# Altium project Carrier-Board-v1.0.PrjPcb (part 5 of 9)

## Sheet FUTURE_USE_CONNECTOR.SchDoc
size A4; SheetNumber: 10; SheetTotal: 20
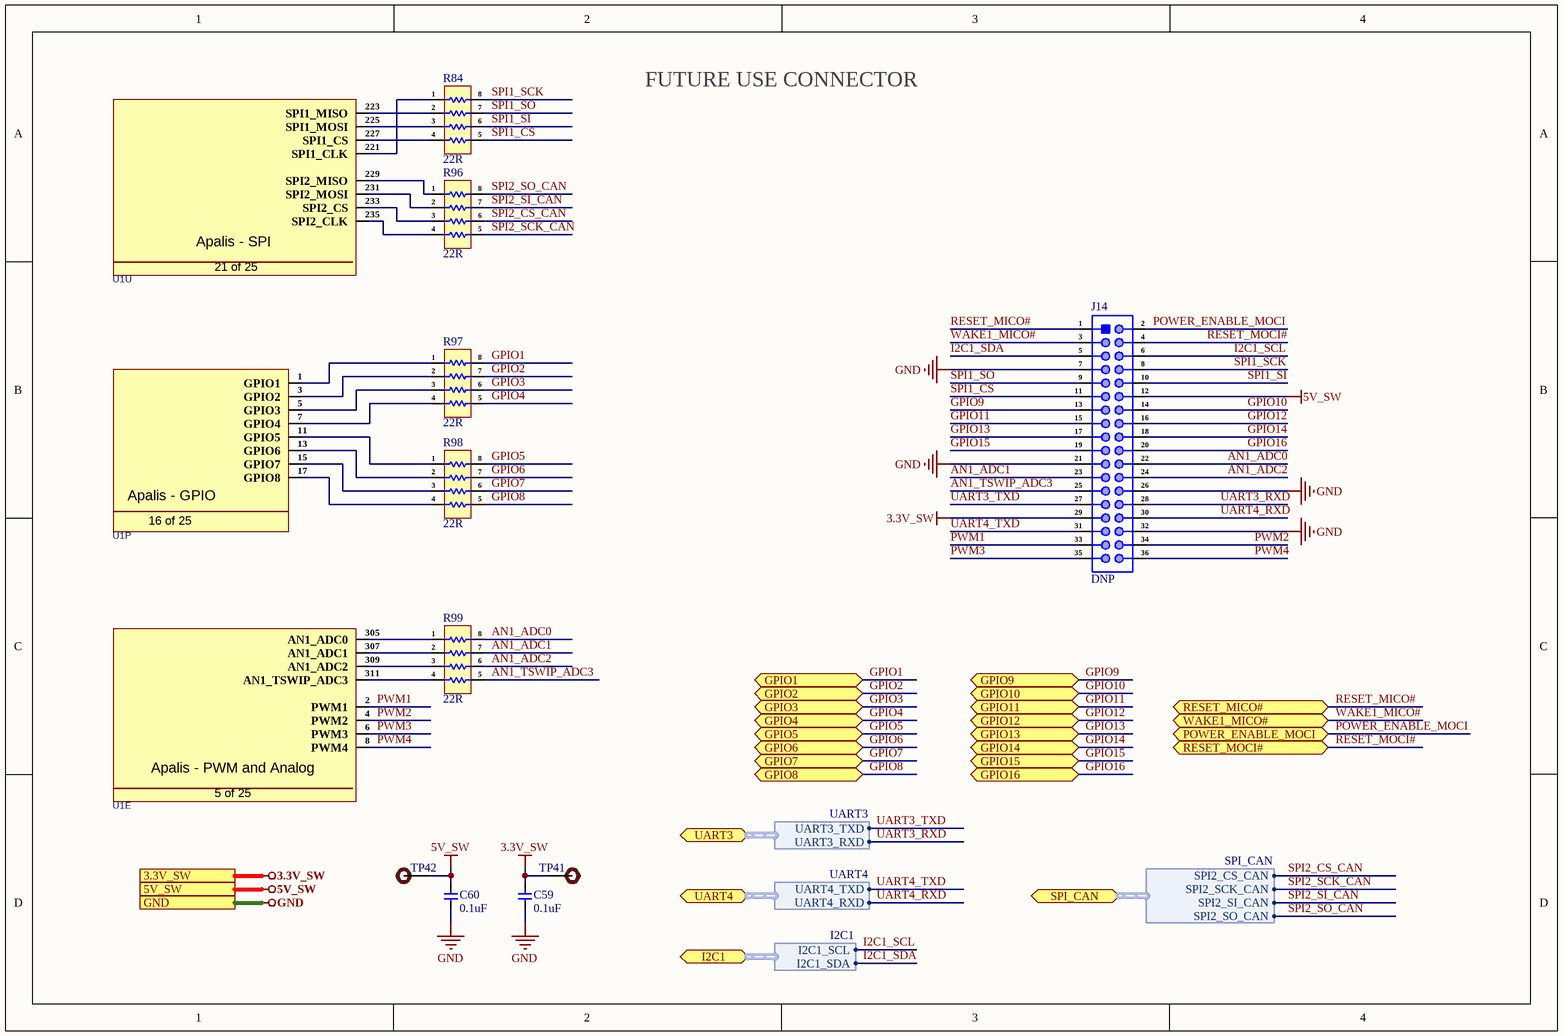
[diagram p9: FUTURE_USE_CONNECTOR.SchDoc]

### Parts
C59  0.1uF  [Cap-0402]
C60  0.1uF  [Cap-0402]
J14  DNP  [ESHF-118-01-L-D-SM-TR]
R84  22R  [YC164-JR-0722RL]
R96  22R  [YC164-JR-0722RL]
R97  22R  [YC164-JR-0722RL]
R98  22R  [YC164-JR-0722RL]
R99  22R  [YC164-JR-0722RL]
TP41  DNP  [Test-point]  (value not drawn)
TP42  DNP  [Test-point]  (value not drawn)
U1  MM70-314B1-2-R300  [MM70-314B1-2-R300]  (value not drawn)  (parts E,P,U of 25)

### Ports
3.3V_SW (see Top_Sheet[2A], DIGITAL_I-O_O-P[1D], ETHERNET_INTERFACE[1D], HDMI_INTERFACE[1D], I2C_INTERFACE[1B], MICRO_SD_CARD_INTERFACE[1D], UART_INTERFACE[1D]), 5V_SW (see Top_Sheet[2A], APALIS_POWER_SUPPLY[1D], CODEC_INTERFACE[1D], HDMI_INTERFACE[1D], LTE_MODULE[1D], USB3.0_INTERFACE[1D]), GND (see Top_Sheet[2A], 03-CAN2_SPI_CAN_CONTROLLER[1D], APALIS_POWER_SUPPLY[1D], CAN2_SPI_CAN_CONTROLLER[1D], CODEC_INTERFACE[1D], CONNECTORS[1D], DC_DC_CONVERTER[1D], DIGITAL_I-O_O-P[1D], ETHERNET_INTERFACE[1D], GPIO_NC_INTERFACE[4B], HDMI_INTERFACE[1D], I2C_INTERFACE[1B], INPUT_SUPPLY_PROTECTION[1D], LTE_MODULE[1D], MECHANICAL_FOR_PCB[1D], MICRO_SD_CARD_INTERFACE[1D], Reset_and_SDIO[1D], UART_INTERFACE[1D], USB3.0_INTERFACE[1D]), GPIO1 (bidir, see Top_Sheet[3B], DIGITAL_I-O_O-P[1C]), GPIO2 (bidir, see Top_Sheet[3B], DIGITAL_I-O_O-P[1C]), GPIO3 (bidir, see Top_Sheet[3B], DIGITAL_I-O_O-P[1C]), GPIO4 (bidir, see Top_Sheet[3B], DIGITAL_I-O_O-P[1C]), GPIO5 (bidir, see Top_Sheet[2A], CONNECTORS[2D]), GPIO6 (bidir, see Top_Sheet[2A], CONNECTORS[2D]), GPIO7 (bidir, see Top_Sheet[2A], CONNECTORS[2D]), GPIO8 (bidir, see Top_Sheet[2A], CONNECTORS[2D]), GPIO9 (bidir, see Top_Sheet[2A], CONNECTORS[2D], GPIO_NC_INTERFACE[1D]), GPIO10 (bidir, see Top_Sheet[2A], GPIO_NC_INTERFACE[1D]), GPIO11 (bidir, see Top_Sheet[2B], CONNECTORS[2D], GPIO_NC_INTERFACE[3B]), GPIO12 (bidir, see Top_Sheet[2B], CONNECTORS[2D], GPIO_NC_INTERFACE[3B]), GPIO13 (bidir, see Top_Sheet[2B], CONNECTORS[2D], GPIO_NC_INTERFACE[3B]), GPIO14 (bidir, see Top_Sheet[2B], GPIO_NC_INTERFACE[2A]), GPIO15 (bidir, see Top_Sheet[2B], GPIO_NC_INTERFACE[2A]), GPIO16 (bidir, see Top_Sheet[3B], GPIO_NC_INTERFACE[2A]), I2C1 (bidir, harness I2C1, see Top_Sheet[3A], CONNECTORS[2C], I2C_INTERFACE[4B]), POWER_ENABLE_MOCI (bidir, see Top_Sheet[3A], Reset_and_SDIO[3D]), RESET_MICO# (bidir, see Top_Sheet[3A], Reset_and_SDIO[3D]), RESET_MOCI# (bidir, see Top_Sheet[3A], Reset_and_SDIO[3D]), SPI_CAN (bidir, harness SPI_CAN, see Top_Sheet[2B], CAN2_SPI_CAN_CONTROLLER[3D]), UART3 (bidir, harness UART3, see Top_Sheet[2B], UART_INTERFACE[3D]), UART4 (bidir, harness UART4, see Top_Sheet[2B], UART_INTERFACE[3D]), WAKE1_MICO# (bidir, see Top_Sheet[3A], I2C_INTERFACE[2B], Reset_and_SDIO[3D])

### Harnesses
I2C1: I2C1_SCL, I2C1_SDA
UART3: UART3_TXD, UART3_RXD
UART4: UART4_TXD, UART4_RXD
SPI_CAN: SPI2_CS_CAN, SPI2_SCK_CAN, SPI2_SI_CAN, SPI2_SO_CAN

### Nets
3.3V_SW: C59.2 J14.29 TP41.1 ; port 3.3V_SW
5V_SW: C60.2 J14.12 TP42.1 ; port 5V_SW
GND: C59.1 C60.1 J14.7 J14.21 J14.26 J14.32 ; port GND
AN1_ADC0: J14.22 R99.8
AN1_ADC1: J14.23 R99.7
AN1_ADC2: J14.24 R99.6
AN1_TSWIP_ADC3: J14.25 R99.5
GPIO1: R97.8 ; port GPIO1
GPIO2: R97.7 ; port GPIO2
GPIO3: R97.6 ; port GPIO3
GPIO4: R97.5 ; port GPIO4
GPIO5: R98.8 ; port GPIO5
GPIO6: R98.7 ; port GPIO6
GPIO7: R98.6 ; port GPIO7
GPIO8: R98.5 ; port GPIO8
GPIO9: J14.13 ; port GPIO9
GPIO10: J14.14 ; port GPIO10
GPIO11: J14.15 ; port GPIO11
GPIO12: J14.16 ; port GPIO12
GPIO13: J14.17 ; port GPIO13
GPIO14: J14.18 ; port GPIO14
GPIO15: J14.19 ; port GPIO15
GPIO16: J14.20 ; port GPIO16
I2C1_SCL: J14.6 ; port I2C1.I2C1_SCL  [project net I2C1.I2C1_SCL]
I2C1_SDA: J14.5 ; port I2C1.I2C1_SDA  [project net I2C1.I2C1_SDA]
POWER_ENABLE_MOCI: J14.2 ; port POWER_ENABLE_MOCI
PWM1: J14.33 U1.2(PWM1)
PWM2: J14.34 U1.4(PWM2)
PWM3: J14.35 U1.6(PWM3)
PWM4: J14.36 U1.8(PWM4)
RESET_MICO#: J14.1 ; port RESET_MICO#
RESET_MOCI#: J14.4 ; port RESET_MOCI#
SPI1_CS: J14.11 R84.5
SPI1_SCK: J14.8 R84.8
SPI1_SI: J14.10 R84.6
SPI1_SO: J14.9 R84.7
SPI2_CS_CAN: R96.6 ; port SPI_CAN.SPI2_CS_CAN
SPI2_SCK_CAN: R96.5 ; port SPI_CAN.SPI2_SCK_CAN
SPI2_SI_CAN: R96.7 ; port SPI_CAN.SPI2_SI_CAN
SPI2_SO_CAN: R96.8 ; port SPI_CAN.SPI2_SO_CAN
UART3_RXD: J14.28 ; port UART3.UART3_RXD  [project net UART3.UART3_RXD]
UART3_TXD: J14.27 ; port UART3.UART3_TXD  [project net UART3.UART3_TXD]
UART4_RXD: J14.30 ; port UART4.UART4_RXD  [project net UART4.UART4_RXD]
UART4_TXD: J14.31 ; port UART4.UART4_TXD  [project net UART4.UART4_TXD]
WAKE1_MICO#: J14.3 ; port WAKE1_MICO#
NetR84_1: R84.1 U1.221(SPI1_CLK)
NetR84_2: R84.2 U1.223(SPI1_MISO)
NetR84_3: R84.3 U1.225(SPI1_MOSI)
NetR84_4: R84.4 U1.227(SPI1_CS)
NetR96_1: R96.1 U1.229(SPI2_MISO)
NetR96_2: R96.2 U1.231(SPI2_MOSI)
NetR96_3: R96.3 U1.233(SPI2_CS)
NetR96_4: R96.4 U1.235(SPI2_CLK)
NetR97_1: R97.1 U1.1(GPIO1)
NetR97_2: R97.2 U1.3(GPIO2)
NetR97_3: R97.3 U1.5(GPIO3)
NetR97_4: R97.4 U1.7(GPIO4)
NetR98_1: R98.1 U1.11(GPIO5)
NetR98_2: R98.2 U1.13(GPIO6)
NetR98_3: R98.3 U1.15(GPIO7)
NetR98_4: R98.4 U1.17(GPIO8)
NetR99_1: R99.1 U1.305(AN1_ADC0)
NetR99_2: R99.2 U1.307(AN1_ADC1)
NetR99_3: R99.3 U1.309(AN1_ADC2)
NetR99_4: R99.4 U1.311(AN1_TSWIP_ADC3)

### Notes on the sheet
- FUTURE USE CONNECTOR
- (in symbol MM70-314B1-2-R300, part E) Apalis - PWM and Analog; 5 of 25
- (in symbol MM70-314B1-2-R300, part P) Apalis - GPIO; 16 of 25
- (in symbol MM70-314B1-2-R300, part U) Apalis - SPI; 21 of 25

### Library data of the parts
C59 C60 = C0402C104K4REC7867: Cap Cer 0402 0.1UF 16V X7R 10%; Manufacturer: KEMET; Item Type: Capacitor; Supplier: Digi-Key; Supplier Part Number: 399-C0402C104K4REC7867CT-ND; Manufacturer Part Number: C0402C104K4REC7867; RoHS: No; Category: Ceramic Capacitors; Stock: 10918; Pricing: 1=0.1, 10=0.072, 50=0.0408, 100=0.0338, 500=0.02372, 1000=0.01963, 2500=0.01827, 5000=0.01672 (USD)
J14 = ESHF-118-01-L-D-SM-TR: CONN HEADER SMD 36POS 1.27MM; Manufacturer: Samtec; Supplier: Digi-Key; Supplier Part Number: ESHF-118-01-L-D-SM-TR-ND; Manufacturer Part Number: ESHF-118-01-L-D-SM-TR; RoHS: Yes; Category: Connectors; Pricing: 375=5.42571 (USD); RoHS Compliant: No
R84 R96-R99 = YC164-JR-0722RL: RES ARRAY 4 RES 22 OHM 1206; Manufacturer: Yageo; Supplier: Future Electronics; Supplier Part Number: 4472155; Manufacturer Part Number: YC164-JR-0722RL; RoHS: Yes; Category: Resistor Arrays; Stock: 225000; Pricing: 5000=0.0084, 20000=0.008, 50000=0.0078, 125000=0.0075, 200000=0.0071 (USD); ComponentLink1URL: https://datasheet.ciiva.com/8018/443424-8018007.pdf?src-supplier=Element14; ComponentLink1Description: https://datasheet.ciiva.com/8018/443424-8018007.pdf?src-supplier=Element14; ComponentLink2URL: https://datasheet.ciiva.com/8018/443424-8018008.pdf?src-supplier=Element14; ComponentLink2Description: https://datasheet.ciiva.com/8018/443424-8018008.pdf?src-supplier=Element14; ComponentLink3URL: https://datasheet.ciiva.com/2688/pyu-yc-tc164-51-rohs-l-3-2688422.pdf?src-supplier=Digi-Key; ComponentLink3Description: https://datasheet.ciiva.com/2688/pyu-yc-tc164-51-rohs-l-3-2688422.pdf?src-supplier=Digi-Key; ComponentLink4URL: https://datasheet.ciiva.com/2688/pyu-yc-tc164-51-rohs-l-3-2688421.pdf?src-supplier=Digi-Key; ComponentLink4Description: https://datasheet.ciiva.com/2688/pyu-yc-tc164-51-rohs-l-3-2688421.pdf?src-supplier=Digi-Key; ComponentLink5URL: https://datasheet.ciiva.com/8320/pyu-yc-tc164-51-rohs-l-3-8320230.pdf?src-supplier=Avnet; ComponentLink5Description: https://datasheet.ciiva.com/8320/pyu-yc-tc164-51-rohs-l-3-8320230.pdf?src-supplier=Avnet; ComponentLink6URL: https://datasheet.ciiva.com/2688/pyu-yc-tc164-51-rohs-l-3-2688423.pdf?src-supplier=Digi-Key; ComponentLink6Description: https://datasheet.ciiva.com/2688/pyu-yc-tc164-51-rohs-l-3-2688423.pdf?src-supplier=Digi-Key; ComponentLink7URL: https://datasheet.ciiva.com/17030/pyu-yc-tc164-51-rohs-l-3-17030158.pdf?src-supplier=Future+Electronics; ComponentLink7Description: https://datasheet.ciiva.com/17030/pyu-yc-tc164-51-rohs-l-3-17030158.pdf?src-supplier=Future+Electronics; ComponentLink8URL: https://datasheet.ciiva.com/28379/pyu-yc-tc164-51-rohs-l-3-28379358.pdf?; ComponentLink8Description: https://datasheet.ciiva.com/28379/pyu-yc-tc164-51-rohs-l-3-28379358.pdf?
TP41 TP42 = TEST POINT: Test Point ON; Item Type: TEST POINT
U1 = MM70-314B1-2-R300: CONN MXM 3.0 FMALE 314POS 0.020; Manufacturer: JAE Electronics; Supplier: Digi-Key; Supplier Part Number: 670-MM70-314B1-2-R300CT-ND; Manufacturer Part Number: MM70-314B1-2-R300; RoHS: No; Category: Card Edge Connectors; Stock: 4979; Pricing: 1=9.21, 10=8.287, 25=7.8064, 50=7.6064, 100=7.4062 (USD)

## Sheet Reset_and_SDIO.SchDoc
size A4; SheetNumber: 11; SheetTotal: 20
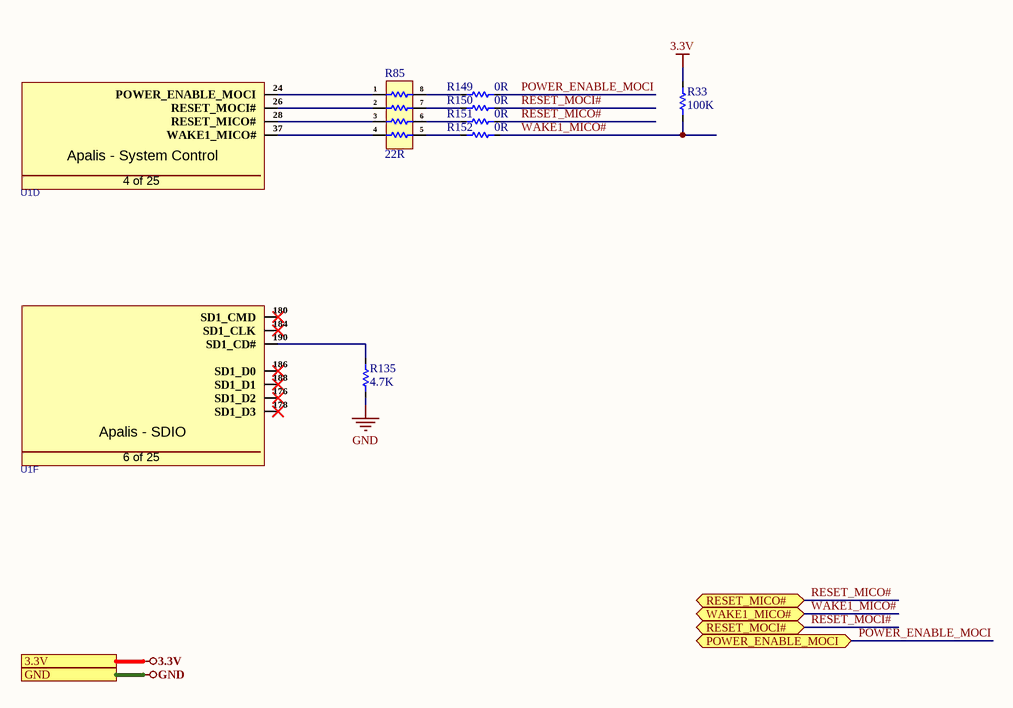
[diagram p10: Reset_and_SDIO.SchDoc]

### Parts
R33  100K  [Res-0402]
R85  22R  [YC164-JR-0722RL]
R135  4.7K  [Res-0603]
R149  0R  [Res-0402]
R150  0R  [Res-0402]
R151  0R  [Res-0402]
R152  0R  [Res-0402]
U1  MM70-314B1-2-R300  [MM70-314B1-2-R300]  (value not drawn)  (parts D,F of 25)

### Ports
3.3V (see Top_Sheet[3A], 03-CAN2_SPI_CAN_CONTROLLER[1D], APALIS_POWER_SUPPLY[1D], CAN2_SPI_CAN_CONTROLLER[1D], DC_DC_CONVERTER[1D], GPIO_NC_INTERFACE[4B], I2C_INTERFACE[1B], LTE_MODULE[1D]), GND (see Top_Sheet[3A], 03-CAN2_SPI_CAN_CONTROLLER[1D], APALIS_POWER_SUPPLY[1D], CAN2_SPI_CAN_CONTROLLER[1D], CODEC_INTERFACE[1D], CONNECTORS[1D], DC_DC_CONVERTER[1D], DIGITAL_I-O_O-P[1D], ETHERNET_INTERFACE[1D], FUTURE_USE_CONNECTOR[1D], GPIO_NC_INTERFACE[4B], HDMI_INTERFACE[1D], I2C_INTERFACE[1B], INPUT_SUPPLY_PROTECTION[1D], LTE_MODULE[1D], MECHANICAL_FOR_PCB[1D], MICRO_SD_CARD_INTERFACE[1D], UART_INTERFACE[1D], USB3.0_INTERFACE[1D]), POWER_ENABLE_MOCI (bidir, see Top_Sheet[3A], FUTURE_USE_CONNECTOR[4C]), RESET_MICO# (bidir, see Top_Sheet[3A], FUTURE_USE_CONNECTOR[4C]), RESET_MOCI# (bidir, see Top_Sheet[3A], FUTURE_USE_CONNECTOR[4C]), WAKE1_MICO# (bidir, see Top_Sheet[3A], FUTURE_USE_CONNECTOR[4C], I2C_INTERFACE[2B])

### Nets
3.3V: R33.2 ; port 3.3V
GND: R135.1 ; port GND
POWER_ENABLE_MOCI: R149.2 ; port POWER_ENABLE_MOCI
RESET_MICO#: R151.2 ; port RESET_MICO#
RESET_MOCI#: R150.2 ; port RESET_MOCI#
WAKE1_MICO#: R33.1 R152.2 ; port WAKE1_MICO#
NetR85_1: R85.1 U1.24(POWER_ENABLE_MOCI)
NetR85_2: R85.2 U1.26(RESET_MOCI#)
NetR85_3: R85.3 U1.28(RESET_MICO#)
NetR85_4: R85.4 U1.37(WAKE1_MICO#)
NetR85_5: R85.5 R152.1
NetR85_6: R85.6 R151.1
NetR85_7: R85.7 R150.1
NetR85_8: R85.8 R149.1
NetR135_2: R135.2 U1.190(SD1_CD#)

Not connected (* = marked no-connect by the designer): U1 176(SD1_D2)* 178(SD1_D3)* 180(SD1_CMD)* 184(SD1_CLK)* 186(SD1_D0)* 188(SD1_D1)*

### Notes on the sheet
- (in symbol MM70-314B1-2-R300, part D) Apalis - System Control; 4 of 25
- (in symbol MM70-314B1-2-R300, part F) Apalis - SDIO; 6 of 25

### Library data of the parts
R33 = RC0402JR-07100KL: RES 100K OHM 5% 1/16W 0402; Manufacturer: Yageo; Voltage Rating: 50V; Value: 100kR; Power Rating: 62.5mW; Temperature Coefficient: 100ppm/°C; Max Power Dissipation: 63mW; Supplier: Future Electronics; Supplier Part Number: 4246625; Manufacturer Part Number: RC0402JR-07100KL; RoHS: Yes; Category: Chip SMD Resistors; Stock: 7540000; Pricing: 10000=0.0013, 100000=0.0008, 200000=0.0013, 400000=0.0008, 750000=0.0012, 1250000=0.0007, 2500000=0.0012, 4000000=0.0007, 10000000=0.0011 (USD); Case/Package: 0402; Case Code (Metric): 1005; Case Code (Imperial): 0402; Min Operating Temperature: -55°C; Max Operating Temperature: 155°C; Packaging: Tape and Reel; Termination: SMD/SMT; Tolerance: 5%; Series: RC; Resistor Type: Thick Film; Number of Terminations: 2; Features: Moisture Resistant; Resistance Tolerance: 5%; Construction: Rectangular; Length: 1mm; Depth: 0.5mm; Lead Free: Lead Free; Reach SVHC Compliant: Unknown; RoHS Compliant: Yes; Military Standard: Not; ComponentLink1URL: https://datasheet.ciiva.com/2491/pyu-r-int-thick-7-2491208.pdf?src-supplier=Digi-Key; ComponentLink1Description: https://datasheet.ciiva.com/2491/pyu-r-int-thick-7-2491208.pdf?src-supplier=Digi-Key; ComponentLink2URL: https://datasheet.ciiva.com/46394/1018594-46394941.pdf?src-supplier=Element14; ComponentLink2Description: https://datasheet.ciiva.com/46394/1018594-46394941.pdf?src-supplier=Element14; ComponentLink3URL: https://datasheet.ciiva.com/2491/pyu-r-int-thick-7-2491209.pdf?src-supplier=Digi-Key; ComponentLink3Description: https://datasheet.ciiva.com/2491/pyu-r-int-thick-7-2491209.pdf?src-supplier=Digi-Key; ComponentLink4URL: https://datasheet.ciiva.com/2491/pyu-r-int-thick-7-2491207.pdf?src-supplier=Digi-Key; ComponentLink4Description: https://datasheet.ciiva.com/2491/pyu-r-int-thick-7-2491207.pdf?src-supplier=Digi-Key; ComponentLink5URL: https://datasheet.ciiva.com/12668/pyu-rc0402-51-rohs-l-6-r-12668218.pdf?src-supplier=Mouser; ComponentLink5Description: https://datasheet.ciiva.com/12668/pyu-rc0402-51-rohs-l-6-r-12668218.pdf?src-supplier=Mouser
R85 = YC164-JR-0722RL: as R84 on sheet FUTURE_USE_CONNECTOR; Supplier: Future Electronics; Supplier Part Number: 4472155; Manufacturer Part Number: YC164-JR-0722RL; RoHS: Yes; Category: Resistor Arrays; Stock: 225000; Pricing: 5000=0.0084, 20000=0.008, 50000=0.0078, 125000=0.0075, 200000=0.0071 (USD); ComponentLink1URL: https://datasheet.ciiva.com/8018/443424-8018007.pdf?src-supplier=Element14; ComponentLink1Description: https://datasheet.ciiva.com/8018/443424-8018007.pdf?src-supplier=Element14; ComponentLink2URL: https://datasheet.ciiva.com/8018/443424-8018008.pdf?src-supplier=Element14; ComponentLink2Description: https://datasheet.ciiva.com/8018/443424-8018008.pdf?src-supplier=Element14; ComponentLink3URL: https://datasheet.ciiva.com/2688/pyu-yc-tc164-51-rohs-l-3-2688422.pdf?src-supplier=Digi-Key; ComponentLink3Description: https://datasheet.ciiva.com/2688/pyu-yc-tc164-51-rohs-l-3-2688422.pdf?src-supplier=Digi-Key; ComponentLink4URL: https://datasheet.ciiva.com/2688/pyu-yc-tc164-51-rohs-l-3-2688421.pdf?src-supplier=Digi-Key; ComponentLink4Description: https://datasheet.ciiva.com/2688/pyu-yc-tc164-51-rohs-l-3-2688421.pdf?src-supplier=Digi-Key; ComponentLink5URL: https://datasheet.ciiva.com/8320/pyu-yc-tc164-51-rohs-l-3-8320230.pdf?src-supplier=Avnet; ComponentLink5Description: https://datasheet.ciiva.com/8320/pyu-yc-tc164-51-rohs-l-3-8320230.pdf?src-supplier=Avnet; ComponentLink6URL: https://datasheet.ciiva.com/2688/pyu-yc-tc164-51-rohs-l-3-2688423.pdf?src-supplier=Digi-Key; ComponentLink6Description: https://datasheet.ciiva.com/2688/pyu-yc-tc164-51-rohs-l-3-2688423.pdf?src-supplier=Digi-Key; ComponentLink7URL: https://datasheet.ciiva.com/17030/pyu-yc-tc164-51-rohs-l-3-17030158.pdf?src-supplier=Future+Electronics; ComponentLink7Description: https://datasheet.ciiva.com/17030/pyu-yc-tc164-51-rohs-l-3-17030158.pdf?src-supplier=Future+Electronics; ComponentLink8URL: https://datasheet.ciiva.com/28379/pyu-yc-tc164-51-rohs-l-3-28379358.pdf?; ComponentLink8Description: https://datasheet.ciiva.com/28379/pyu-yc-tc164-51-rohs-l-3-28379358.pdf?
R135 = ERA-3AEB472V: RES SMD 4.7K OHM 0.1% 1/10W 0603; Manufacturer: Panasonic; Supplier: Rs; Supplier Part Number: 566888P; Manufacturer Part Number: ERA-3AEB472V; RoHS: Yes; Category: Chip SMD Resistors; Stock: 5210; Pricing: 50=0.242, 100=0.198, 250=0.156, 500=0.114 (GBP); ComponentLink1URL: https://datasheet.ciiva.com/11808/0900766b80fe20f7-11808039.pdf?src-supplier=Rs; ComponentLink1Description: https://datasheet.ciiva.com/11808/0900766b80fe20f7-11808039.pdf?src-supplier=Rs; ComponentLink2URL: https://datasheet.ciiva.com/29183/451124-da-01-en-widerstand-0603-era-29183789.pdf?src-supplier=Conrad; ComponentLink2Description: https://datasheet.ciiva.com/29183/451124-da-01-en-widerstand-0603-era-29183789.pdf?src-supplier=Conrad; ComponentLink3URL: https://datasheet.ciiva.com/22743/485442-22743061.pdf?src-supplier=Element14; ComponentLink3Description: https://datasheet.ciiva.com/22743/485442-22743061.pdf?src-supplier=Element14; ComponentLink4URL: https://datasheet.ciiva.com/46422/485442-46422693.pdf?src-supplier=Element14; ComponentLink4Description: https://datasheet.ciiva.com/46422/485442-46422693.pdf?src-supplier=Element14; ComponentLink5URL: https://datasheet.ciiva.com/30078/54aoa0000ce26-30078815.pdf?src-supplier=Onlinecomponents.com; ComponentLink5Description: https://datasheet.ciiva.com/30078/54aoa0000ce26-30078815.pdf?src-supplier=Onlinecomponents.com; ComponentLink6URL: https://datasheet.ciiva.com/16772/70068849-16772572.pdf?src-supplier=Allied+Electronics; ComponentLink6Description: https://datasheet.ciiva.com/16772/70068849-16772572.pdf?src-supplier=Allied+Electronics; ComponentLink7URL: https://datasheet.ciiva.com/48425/era-eng-tds-48425470.pdf?src-supplier=Distrelec; ComponentLink7Description: https://datasheet.ciiva.com/48425/era-eng-tds-48425470.pdf?src-supplier=Distrelec; ComponentLink8URL: https://datasheet.ciiva.com/22781/485442-22781497.pdf?src-supplier=Farnell; ComponentLink8Description: https://datasheet.ciiva.com/22781/485442-22781497.pdf?src-supplier=Farnell; ComponentLink9URL: https://datasheet.ciiva.com/43455/485442-43455227.pdf?src-supplier=Farnell; ComponentLink9Description: https://datasheet.ciiva.com/43455/485442-43455227.pdf?src-supplier=Farnell; ComponentLink10URL: https://datasheet.ciiva.com/9117/aoa0000ce26-9117707.pdf?src-supplier=Avnet; ComponentLink10Description: https://datasheet.ciiva.com/9117/aoa0000ce26-9117707.pdf?src-supplier=Avnet; ComponentLink11URL: https://datasheet.ciiva.com/9116/aoa0000ce26-9116681.pdf?src-supplier=Avnet; ComponentLink11Description: https://datasheet.ciiva.com/9116/aoa0000ce26-9116681.pdf?src-supplier=Avnet
R149-R152 = ERJ-2GE0R00X: RES SMD 0 OHM JUMPER 1/10W 0402; Manufacturer: Panasonic; Value: 0mR; Power Rating: 100mW; Voltage Rating: 50V; Tolerance: 5%; Temperature Coefficient: 600ppm/°C; Supplier: Mouser; Supplier Part Number: 667-ERJ-2GE0R00X; Manufacturer Part Number: ERJ-2GE0R00X; RoHS: Yes; Category: Chip SMD Resistors; Stock: 10959876; Pricing: 1=0.1, 10=0.013, 50=0.013, 100=0.006, 1000=0.004, 10000=0.003 (USD); Mounting Technology: Surface Mount; Case/Package: 0402; Pins: 2NUMBER; Contact Plating: Tin; Case Code (Metric): 1005; Case Code (Imperial): 0402; Min Operating Temperature: -55°C; Max Operating Temperature: 155°C; Resistor Type: Thick Film; Packaging: Cut Tape; Package Quantity: 10000; Number of Terminations: 2; Termination: SMD/SMT; Max Power Dissipation: 100mW; Voltage Rating (DC): 50V; Features: Automotive AEC-Q200; Series: ERJ; Construction: Rectangular; Technology: THICK FILM; Length: 1mm; Width: 0.5mm; Height: 0.35mm; Depth: 0.5mm; Ratings: AEC-Q200; Radiation Hardening: No; Reach SVHC Compliant: No; Military Standard: Not; Lead Free: Lead Free; RoHS Compliant: Yes; ComponentLink1URL: https://datasheet.ciiva.com/11821/0900766b80f806dd-11821176.pdf?src-supplier=Rs; ComponentLink1Description: https://datasheet.ciiva.com/11821/0900766b80f806dd-11821176.pdf?src-supplier=Rs; ComponentLink2URL: https://datasheet.ciiva.com/46389/1678796-46389518.pdf?src-supplier=Element14; ComponentLink2Description: https://datasheet.ciiva.com/46389/1678796-46389518.pdf?src-supplier=Element14; ComponentLink3URL: https://datasheet.ciiva.com/28695/1678796-28695758.pdf?src-supplier=Element14; ComponentLink3Description: https://datasheet.ciiva.com/28695/1678796-28695758.pdf?src-supplier=Element14; ComponentLink4URL: https://datasheet.ciiva.com/16778/70260739-16778335.pdf?src-supplier=Allied+Electronics; ComponentLink4Description: https://datasheet.ciiva.com/16778/70260739-16778335.pdf?src-supplier=Allied+Electronics; ComponentLink5URL: https://datasheet.ciiva.com/48531/aoa0000ce1-48531077.pdf?src-supplier=Avnet; ComponentLink5Description: https://datasheet.ciiva.com/48531/aoa0000ce1-48531077.pdf?src-supplier=Avnet; ComponentLink6URL: https://datasheet.ciiva.com/30097/4aoa0000ce1-30097116.pdf?src-supplier=Onlinecomponents.com; ComponentLink6Description: https://datasheet.ciiva.com/30097/4aoa0000ce1-30097116.pdf?src-supplier=Onlinecomponents.com; ComponentLink7URL: https://datasheet.ciiva.com/43460/1678796-43460347.pdf?src-supplier=Farnell; ComponentLink7Description: https://datasheet.ciiva.com/43460/1678796-43460347.pdf?src-supplier=Farnell; ComponentLink8URL: https://datasheet.ciiva.com/5959/1678796-5959692.pdf?src-supplier=Farnell; ComponentLink8Description: https://datasheet.ciiva.com/5959/1678796-5959692.pdf?src-supplier=Farnell; ComponentLink9URL: https://datasheet.ciiva.com/16783/70260739-16783734.pdf?src-supplier=Allied+Electronics; ComponentLink9Description: https://datasheet.ciiva.com/16783/70260739-16783734.pdf?src-supplier=Allied+Electronics
U1 = MM70-314B1-2-R300: as U1 on sheet FUTURE_USE_CONNECTOR; Supplier: Digi-Key; Supplier Part Number: 670-MM70-314B1-2-R300CT-ND; Manufacturer Part Number: MM70-314B1-2-R300; RoHS: No; Category: Card Edge Connectors; Stock: 4979; Pricing: 1=9.21, 10=8.287, 25=7.8064, 50=7.6064, 100=7.4062 (USD)

## Sheet I2C_INTERFACE.SchDoc
size A4; SheetNumber: 12; SheetTotal: 20
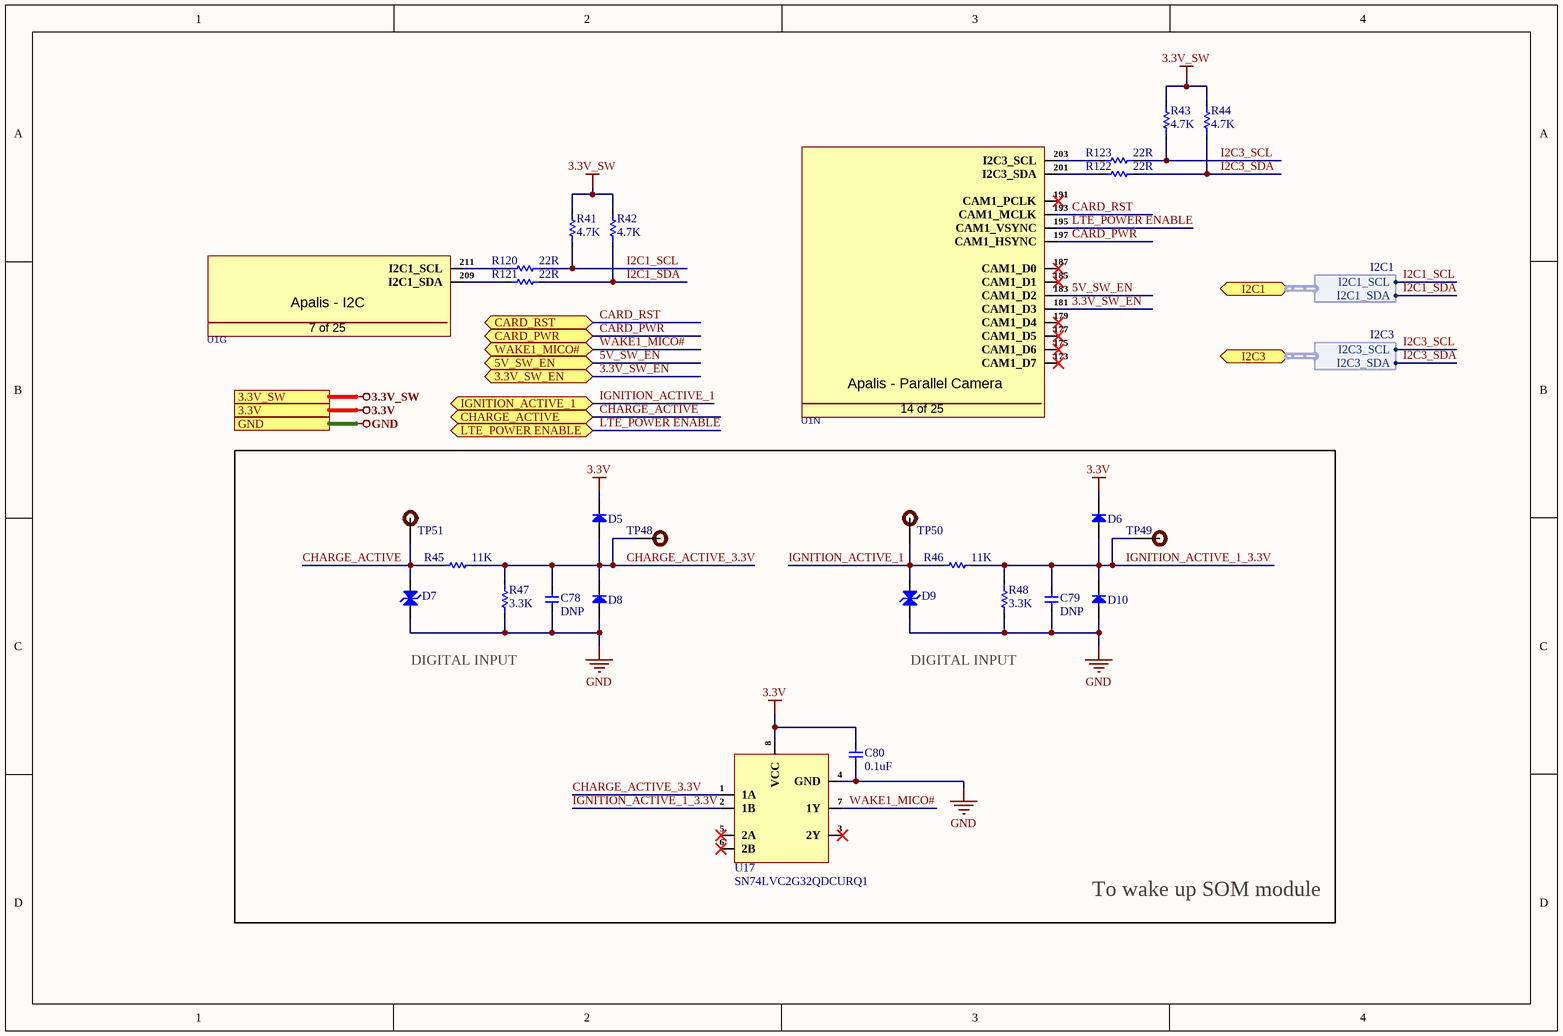
[diagram p11: I2C_INTERFACE.SchDoc]

### Parts
C78  DNP  [Cap-0603]
C79  DNP  [Cap-0603]
C80  0.1uF  [Cap-0402]
D5  BAS316,115  [SOD-323]  (value not drawn)
D6  BAS316,115  [SOD-323]  (value not drawn)
D7  SMAJ14CA-E3/61  [SMA]  (value not drawn)
D8  BAS316,115  [SOD-323]  (value not drawn)
D9  SMAJ14CA-E3/61  [SMA]  (value not drawn)
D10  BAS316,115  [SOD-323]  (value not drawn)
R41  4.7K  [Res-0603]
R42  4.7K  [Res-0603]
R43  4.7K  [Res-0603]
R44  4.7K  [Res-0603]
R45  11K  [Res-0603]
R46  11K  [Res-0603]
R47  3.3K  [Res-0603]
R48  3.3K  [Res-0603]
R120  22R  [Res-0402]
R121  22R  [Res-0402]
R122  22R  [Res-0402]
R123  22R  [Res-0402]
TP48  DNP  [Test-point]  (value not drawn)
TP49  DNP  [Test-point]  (value not drawn)
TP50  DNP  [Test-point]  (value not drawn)
TP51  DNP  [Test-point]  (value not drawn)
U1  MM70-314B1-2-R300  [MM70-314B1-2-R300]  (value not drawn)  (parts G,N of 25)
U17  SN74LVC2G32QDCURQ1  [8-VSSOP]

### Blocks framed on the sheet
To wake up SOM module: C78-C80 D5-D10 R45-R48 TP48-TP51 U17

### Ports
3.3V (see Top_Sheet[3C], 03-CAN2_SPI_CAN_CONTROLLER[1D], APALIS_POWER_SUPPLY[1D], CAN2_SPI_CAN_CONTROLLER[1D], DC_DC_CONVERTER[1D], GPIO_NC_INTERFACE[4B], LTE_MODULE[1D], Reset_and_SDIO[1D]), 3.3V_SW (see Top_Sheet[3C], DIGITAL_I-O_O-P[1D], ETHERNET_INTERFACE[1D], FUTURE_USE_CONNECTOR[1D], HDMI_INTERFACE[1D], MICRO_SD_CARD_INTERFACE[1D], UART_INTERFACE[1D]), 3.3V_SW_EN (bidir, see Top_Sheet[3D], CONNECTORS[2D]), 5V_SW_EN (bidir, see Top_Sheet[3D], CONNECTORS[2D]), CARD_PWR (bidir, see Top_Sheet[2C], LTE_MODULE[3D]), CARD_RST (bidir, see Top_Sheet[2D], LTE_MODULE[3D]), CHARGE_ACTIVE (bidir, see Top_Sheet[3D], CONNECTORS[4D]), GND (see Top_Sheet[2C], 03-CAN2_SPI_CAN_CONTROLLER[1D], APALIS_POWER_SUPPLY[1D], CAN2_SPI_CAN_CONTROLLER[1D], CODEC_INTERFACE[1D], CONNECTORS[1D], DC_DC_CONVERTER[1D], DIGITAL_I-O_O-P[1D], ETHERNET_INTERFACE[1D], FUTURE_USE_CONNECTOR[1D], GPIO_NC_INTERFACE[4B], HDMI_INTERFACE[1D], INPUT_SUPPLY_PROTECTION[1D], LTE_MODULE[1D], MECHANICAL_FOR_PCB[1D], MICRO_SD_CARD_INTERFACE[1D], Reset_and_SDIO[1D], UART_INTERFACE[1D], USB3.0_INTERFACE[1D]), I2C1 (bidir, harness I2C1, see Top_Sheet[3D], CONNECTORS[2C], FUTURE_USE_CONNECTOR[2D]), I2C3 (bidir, harness I2C3, see Top_Sheet[3C], CODEC_INTERFACE[3D], CONNECTORS[2C]), IGNITION_ACTIVE_1 (bidir, see Top_Sheet[3D], CONNECTORS[4D]), LTE_POWER ENABLE (bidir, see Top_Sheet[2D], LTE_MODULE[3D]), WAKE1_MICO# (bidir, see Top_Sheet[2C], FUTURE_USE_CONNECTOR[4C], Reset_and_SDIO[3D])

### Harnesses
I2C3: I2C3_SCL, I2C3_SDA
I2C1: I2C1_SCL, I2C1_SDA

### Nets
3.3V: C80.2 D5.1(K) D6.1(K) U17.8(VCC) ; port 3.3V
3.3V_SW: R41.2 R42.2 R43.2 R44.2 ; port 3.3V_SW
GND: C78.1 C79.1 C80.1 D7.1(A) D8.2(A) D9.1(A) D10.2(A) R47.1 R48.1 U17.4(GND) ; port GND
3.3V_SW_EN: U1.181(CAM1_D3) ; port 3.3V_SW_EN
5V_SW_EN: U1.183(CAM1_D2) ; port 5V_SW_EN
CARD_PWR: U1.197(CAM1_HSYNC) ; port CARD_PWR
CARD_RST: U1.193(CAM1_MCLK) ; port CARD_RST
CHARGE_ACTIVE: D7.2(A) R45.1 TP51.1 ; port CHARGE_ACTIVE
CHARGE_ACTIVE_3.3V: C78.2 D5.2(A) D8.1(K) R45.2 R47.2 TP48.1 U17.1(1A)
I2C1_SCL: R41.1 R120.2 ; port I2C1.I2C1_SCL  [project net I2C1.I2C1_SCL]
I2C1_SDA: R42.1 R121.2 ; port I2C1.I2C1_SDA  [project net I2C1.I2C1_SDA]
I2C3_SCL: R43.1 R123.2 ; port I2C3.I2C3_SCL  [project net I2C3.I2C3_SCL]
I2C3_SDA: R44.1 R122.2 ; port I2C3.I2C3_SDA  [project net I2C3.I2C3_SDA]
IGNITION_ACTIVE_1: D9.2(A) R46.1 TP50.1 ; port IGNITION_ACTIVE_1
IGNITION_ACTIVE_1_3.3V: C79.2 D6.2(A) D10.1(K) R46.2 R48.2 TP49.1 U17.2(1B)
LTE_POWER ENABLE: U1.195(CAM1_VSYNC) ; port LTE_POWER ENABLE
WAKE1_MICO#: U17.7(1Y) ; port WAKE1_MICO#
NetR120_1: R120.1 U1.211(I2C1_SCL)
NetR121_1: R121.1 U1.209(I2C1_SDA)
NetR122_1: R122.1 U1.201(I2C3_SDA)
NetR123_1: R123.1 U1.203(I2C3_SCL)

Not connected (* = marked no-connect by the designer): U1 173(CAM1_D7)* 175(CAM1_D6)* 177(CAM1_D5)* 179(CAM1_D4)* 185(CAM1_D1)* 187(CAM1_D0)* 191(CAM1_PCLK)*; U17 3(2Y)* 5(2A)* 6(2B)*

### Notes on the sheet
- DIGITAL INPUT
- (in symbol MM70-314B1-2-R300, part G) Apalis - I2C; 7 of 25
- (in symbol MM70-314B1-2-R300, part N) Apalis - Parallel Camera; 14 of 25

### Library data of the parts
C78 C79 = C1608NP01H101J080AA: CAP CER 100PF 50V NP0 0603; Manufacturer: TDK; Item Type: Capacitor; Supplier: Arrow Electronics; Supplier Part Number: C1608NP01H101J080AA; Manufacturer Part Number: C1608NP01H101J080AA; RoHS: Yes; Category: Ceramic Capacitors; Stock: 1236; Pricing: 1=0.1172, 10=0.0734, 25=0.0727, 50=0.0628, 100=0.0474, 250=0.0469, 500=0.0388, 1000=0.0313 (USD); ComponentLink1URL: http://www.mouser.com/ds/2/400/tdk_mlcc_commercial_general_en-542463.pdf?src-supplier=Mouser; ComponentLink1Description: http://www.mouser.com/ds/2/400/tdk_mlcc_commercial_general_en-542463.pdf?src-supplier=Mouser; ComponentLink2URL: https://datasheet.octopart.com/C1608NP01H101J080AA-TDK-datasheet-43914282.pdf?src-supplier=Future+Electronics; ComponentLink2Description: https://datasheet.octopart.com/C1608NP01H101J080AA-TDK-datasheet-43914282.pdf?src-supplier=Future+Electronics; ComponentLink3URL: https://product.tdk.com/info/en/catalog/datasheets/mlcc_commercial_hightemp_en.pdf?ref_disty=digikey&src-supplier=Digi-Key; ComponentLink3Description: https://product.tdk.com/info/en/catalog/datasheets/mlcc_commercial_hightemp_en.pdf?ref_disty=digikey&src-supplier=Digi-Key; ComponentLink4URL: https://product.tdk.com/info/en/documents/chara_sheet/C1608NP01H101J080AA.pdf?src-supplier=Digi-Key; ComponentLink4Description: https://product.tdk.com/info/en/documents/chara_sheet/C1608NP01H101J080AA.pdf?src-supplier=Digi-Key; ComponentLink5URL: http://product.tdk.com/en/catalog/datasheets/mlcc_commercial_hightemp_en.pdf?src-supplier=Avnet; ComponentLink5Description: http://product.tdk.com/en/catalog/datasheets/mlcc_commercial_hightemp_en.pdf?src-supplier=Avnet
C80 = C0402C104K4REC7867: as C59 on sheet FUTURE_USE_CONNECTOR; Supplier: Digi-Key; Supplier Part Number: 399-C0402C104K4REC7867CT-ND; Manufacturer Part Number: C0402C104K4REC7867; RoHS: No; Category: Ceramic Capacitors; Stock: 10918; Pricing: 1=0.1, 10=0.072, 50=0.0408, 100=0.0338, 500=0.02372, 1000=0.01963, 2500=0.01827, 5000=0.01672 (USD)
D5 D6 D8 D10 = BAS316,115: Rectifier Diode Switching 100V 0.25A 4ns Automotive 2-Pin SOD-323 T/R; Manufacturer: Nexperia; Forward Current: 250mA; Max Forward Surge Current (Ifsm): 500mA; Value: 1.5pF; Max Reverse Current: 500nA; Supplier: Rs; Supplier Part Number: 1821844P; Manufacturer Part Number: BAS316,115; RoHS: Yes; Category: Rectifier Diodes; Stock: 258600; Pricing: 600=0.062, 1200=0.039, 1800=0.037, 2400=0.035 (GBP); Pins: 2NUMBER; Max Operating Temperature: 150°C; Max Repetitive Reverse Voltage (Vrrm): 100V; Packaging: 10Packaging; Reverse Voltage: 100V; Height: 1.1mm; RoHS Compliant: Yes; ComponentLink1URL: http://www.farnell.com/datasheets/1856332.pdf?src-supplier=Farnell; ComponentLink1Description: http://www.farnell.com/datasheets/1856332.pdf?src-supplier=Farnell; ComponentLink2URL: https://assets.nexperia.com/documents/data-sheet/BAS16_SER.pdf?src-supplier=Digi-Key; ComponentLink2Description: https://assets.nexperia.com/documents/data-sheet/BAS16_SER.pdf?src-supplier=Digi-Key; ComponentLink3URL: https://datasheet.octopart.com/BAS316%2C115-Nexperia-datasheet-77871323.pdf?src-supplier=Future+Electronics; ComponentLink3Description: https://datasheet.octopart.com/BAS316%2C115-Nexperia-datasheet-77871323.pdf?src-supplier=Future+Electronics; ComponentLink4URL: https://datasheet.octopart.com/BAS316%2C115-Nexperia-datasheet-32749520.pdf?src-supplier=Element14; ComponentLink4Description: https://datasheet.octopart.com/BAS316%2C115-Nexperia-datasheet-32749520.pdf?src-supplier=Element14; ComponentLink5URL: http://www.farnell.com/datasheets/1856332.pdf?src-supplier=Newark; ComponentLink5Description: http://www.farnell.com/datasheets/1856332.pdf?src-supplier=Newark; ComponentLink6URL: https://datasheet.octopart.com/BAS316%2C115-NXP-datasheet-5319124.pdf?src-supplier=TME; ComponentLink6Description: https://datasheet.octopart.com/BAS316%2C115-NXP-datasheet-5319124.pdf?src-supplier=TME
D7 D9 = SMAJ14CA-E3/61: TVS DIODE 14VWM 23.2VC DO214AC; Manufacturer: Vishay Semiconductors; Supplier: Mouser; Supplier Part Number: 625-SMAJ14CA-E3; Manufacturer Part Number: SMAJ14CA-E3/61; RoHS: Yes; Category: TVS Diodes; Stock: 15510; Pricing: 1=0.48, 10=0.36, 50=0.36, 100=0.221, 1000=0.127, 10000=0.099 (USD); ComponentLink1URL: https://datasheet.ciiva.com/4515/smaj50a-241759-4515304.pdf?src-supplier=Mouser; ComponentLink1Description: https://datasheet.ciiva.com/4515/smaj50a-241759-4515304.pdf?src-supplier=Mouser; ComponentLink2URL: https://datasheet.ciiva.com/16382/smaj50a-16382075.pdf?src-supplier=Future+Electronics; ComponentLink2Description: https://datasheet.ciiva.com/16382/smaj50a-16382075.pdf?src-supplier=Future+Electronics
R41-R44 = ERA-3AEB472V: as R135 on sheet Reset_and_SDIO; Supplier: Rs; Supplier Part Number: 566888P; Manufacturer Part Number: ERA-3AEB472V; RoHS: Yes; Category: Chip SMD Resistors; Stock: 5210; Pricing: 50=0.242, 100=0.198, 250=0.156, 500=0.114 (GBP); ComponentLink1URL: https://datasheet.ciiva.com/11808/0900766b80fe20f7-11808039.pdf?src-supplier=Rs; ComponentLink1Description: https://datasheet.ciiva.com/11808/0900766b80fe20f7-11808039.pdf?src-supplier=Rs; ComponentLink2URL: https://datasheet.ciiva.com/29183/451124-da-01-en-widerstand-0603-era-29183789.pdf?src-supplier=Conrad; ComponentLink2Description: https://datasheet.ciiva.com/29183/451124-da-01-en-widerstand-0603-era-29183789.pdf?src-supplier=Conrad; ComponentLink3URL: https://datasheet.ciiva.com/22743/485442-22743061.pdf?src-supplier=Element14; ComponentLink3Description: https://datasheet.ciiva.com/22743/485442-22743061.pdf?src-supplier=Element14; ComponentLink4URL: https://datasheet.ciiva.com/46422/485442-46422693.pdf?src-supplier=Element14; ComponentLink4Description: https://datasheet.ciiva.com/46422/485442-46422693.pdf?src-supplier=Element14; ComponentLink5URL: https://datasheet.ciiva.com/30078/54aoa0000ce26-30078815.pdf?src-supplier=Onlinecomponents.com; ComponentLink5Description: https://datasheet.ciiva.com/30078/54aoa0000ce26-30078815.pdf?src-supplier=Onlinecomponents.com; ComponentLink6URL: https://datasheet.ciiva.com/16772/70068849-16772572.pdf?src-supplier=Allied+Electronics; ComponentLink6Description: https://datasheet.ciiva.com/16772/70068849-16772572.pdf?src-supplier=Allied+Electronics; ComponentLink7URL: https://datasheet.ciiva.com/48425/era-eng-tds-48425470.pdf?src-supplier=Distrelec; ComponentLink7Description: https://datasheet.ciiva.com/48425/era-eng-tds-48425470.pdf?src-supplier=Distrelec; ComponentLink8URL: https://datasheet.ciiva.com/22781/485442-22781497.pdf?src-supplier=Farnell; ComponentLink8Description: https://datasheet.ciiva.com/22781/485442-22781497.pdf?src-supplier=Farnell; ComponentLink9URL: https://datasheet.ciiva.com/43455/485442-43455227.pdf?src-supplier=Farnell; ComponentLink9Description: https://datasheet.ciiva.com/43455/485442-43455227.pdf?src-supplier=Farnell; ComponentLink10URL: https://datasheet.ciiva.com/9117/aoa0000ce26-9117707.pdf?src-supplier=Avnet; ComponentLink10Description: https://datasheet.ciiva.com/9117/aoa0000ce26-9117707.pdf?src-supplier=Avnet; ComponentLink11URL: https://datasheet.ciiva.com/9116/aoa0000ce26-9116681.pdf?src-supplier=Avnet; ComponentLink11Description: https://datasheet.ciiva.com/9116/aoa0000ce26-9116681.pdf?src-supplier=Avnet
R45 R46 = RT0603DRD0711KL: RES SMD 11K OHM 0.5% 1/10W 0603; Manufacturer: Yageo; Supplier: Future Electronics; Supplier Part Number: 3061514; Manufacturer Part Number: RT0603DRD0711KL; RoHS: Yes; Category: Chip SMD Resistors; Stock: 70000; Pricing: 5000=0.0133, 15000=0.0128, 25000=0.0126, 100000=0.012, 150000=0.0117 (USD); ComponentLink1URL: https://datasheet.ciiva.com/8891/pyu-rt-1-to-0-05-rohs-l-4-8891301.pdf?src-supplier=Avnet; ComponentLink1Description: https://datasheet.ciiva.com/8891/pyu-rt-1-to-0-05-rohs-l-4-8891301.pdf?src-supplier=Avnet
R47 R48 = ERJ-U3RD3301V: RES 3.3K OHM 0.5% 1/10W 0603 SMD; Manufacturer: Panasonic; Supplier: Mouser; Supplier Part Number: 667-ERJ-U3RD3301V; Manufacturer Part Number: ERJ-U3RD3301V; RoHS: No; Category: Chip SMD Resistors; Stock: 19153; Pricing: 1=0.19, 10=0.105, 50=0.105, 100=0.047, 1000=0.029, 10000=0.023 (USD)
R120-R123 = CRGCQ0402J22R: RES 22 OHM 5% 1/16W 0402; Manufacturer: TE Connectivity; Supplier: Avnet; Supplier Part Number: 73AC8982; Manufacturer Part Number: CRGCQ0402J22R; RoHS: Yes; Category: Chip SMD Resistors; Stock: 20000; Pricing: 1=0.036, 25=0.01, 100=0.008, 250=0.006, 500=0.005 (USD); ComponentLink1URL: https://www.te.com/commerce/DocumentDelivery/DDEController?Action=srchrtrv&amp;DocNm=1773204-3&amp;DocType=DS&amp;DocLang=English&src-supplier=Digi-Key; ComponentLink1Description: https://www.te.com/commerce/DocumentDelivery/DDEController?Action=srchrtrv&amp;DocNm=1773204-3&amp;DocType=DS&amp;DocLang=English&src-supplier=Digi-Key; ComponentLink2URL: https://4donline.ihs.com/images/VipMasterIC/IC/TYEL/TYEL-S-A0004929575/TYEL-S-A0004929575-1.pdf?hkey=52A5661711E402568146F3353EA87419&src-supplier=Newark; ComponentLink2Description: https://4donline.ihs.com/images/VipMasterIC/IC/TYEL/TYEL-S-A0004929575/TYEL-S-A0004929575-1.pdf?hkey=52A5661711E402568146F3353EA87419&src-supplier=Newark; ComponentLink3URL: https://4donline.ihs.com/images/VipMasterIC/IC/TYEL/TYEL-S-A0004929575/TYEL-S-A0004929575-1.pdf?hkey=52A5661711E402568146F3353EA87419&src-supplier=Element14; ComponentLink3Description: https://4donline.ihs.com/images/VipMasterIC/IC/TYEL/TYEL-S-A0004929575/TYEL-S-A0004929575-1.pdf?hkey=52A5661711E402568146F3353EA87419&src-supplier=Element14; ComponentLink4URL: https://datasheet.octopart.com/CRGCQ0402J22R-TE-Connectivity-datasheet-114679081.pdf?src-supplier=Master+Electronics; ComponentLink4Description: https://datasheet.octopart.com/CRGCQ0402J22R-TE-Connectivity-datasheet-114679081.pdf?src-supplier=Master+Electronics
TP48-TP51 = TEST POINT: Test Point ON; Item Type: TEST POINT
U1 = MM70-314B1-2-R300: as U1 on sheet FUTURE_USE_CONNECTOR; Supplier: Digi-Key; Supplier Part Number: 670-MM70-314B1-2-R300CT-ND; Manufacturer Part Number: MM70-314B1-2-R300; RoHS: No; Category: Card Edge Connectors; Stock: 4979; Pricing: 1=9.21, 10=8.287, 25=7.8064, 50=7.6064, 100=7.4062 (USD)
U17 = SN74LVC2G32QDCURQ1: IC GATE OR 2CH 2-INP 8VSSOP; Manufacturer: Texas Instruments; Supplier: Mouser; Supplier Part Number: 595-74LVC2G32QDCURQ1; Manufacturer Part Number: SN74LVC2G32QDCURQ1; RoHS: Yes; Category: Logic Gates; Stock: 7957; Pricing: 1=0.8, 10=0.665, 50=0.665, 100=0.505, 1000=0.343, 10000=0.275 (USD); ComponentLink1URL: https://datasheet.ciiva.com/12072/sn74lvc2g32-q1-213877-12072967.pdf?src-supplier=Mouser; ComponentLink1Description: https://datasheet.ciiva.com/12072/sn74lvc2g32-q1-213877-12072967.pdf?src-supplier=Mouser; ComponentLink2URL: https://datasheet.ciiva.com/6619/sn74lvc2g32-q1-6619488.pdf?src-supplier=Digi-Key; ComponentLink2Description: https://datasheet.ciiva.com/6619/sn74lvc2g32-q1-6619488.pdf?src-supplier=Digi-Key; ComponentLink3URL: https://datasheet.ciiva.com/14311/sn74lvc2g32-q1-14311324.pdf?src-supplier=Avnet; ComponentLink3Description: https://datasheet.ciiva.com/14311/sn74lvc2g32-q1-14311324.pdf?src-supplier=Avnet; ComponentLink4URL: https://datasheet.ciiva.com/6619/sn74lvc2g32-q1-6619483.pdf?src-supplier=Digi-Key; ComponentLink4Description: https://datasheet.ciiva.com/6619/sn74lvc2g32-q1-6619483.pdf?src-supplier=Digi-Key; ComponentLink5URL: https://datasheet.ciiva.com/6619/sn74lvc2g32-q1-6619485.pdf?src-supplier=Digi-Key; ComponentLink5Description: https://datasheet.ciiva.com/6619/sn74lvc2g32-q1-6619485.pdf?src-supplier=Digi-Key

## Sheet GPIO_NC_INTERFACE.SchDoc
size A4; SheetNumber: 13; SheetTotal: 20
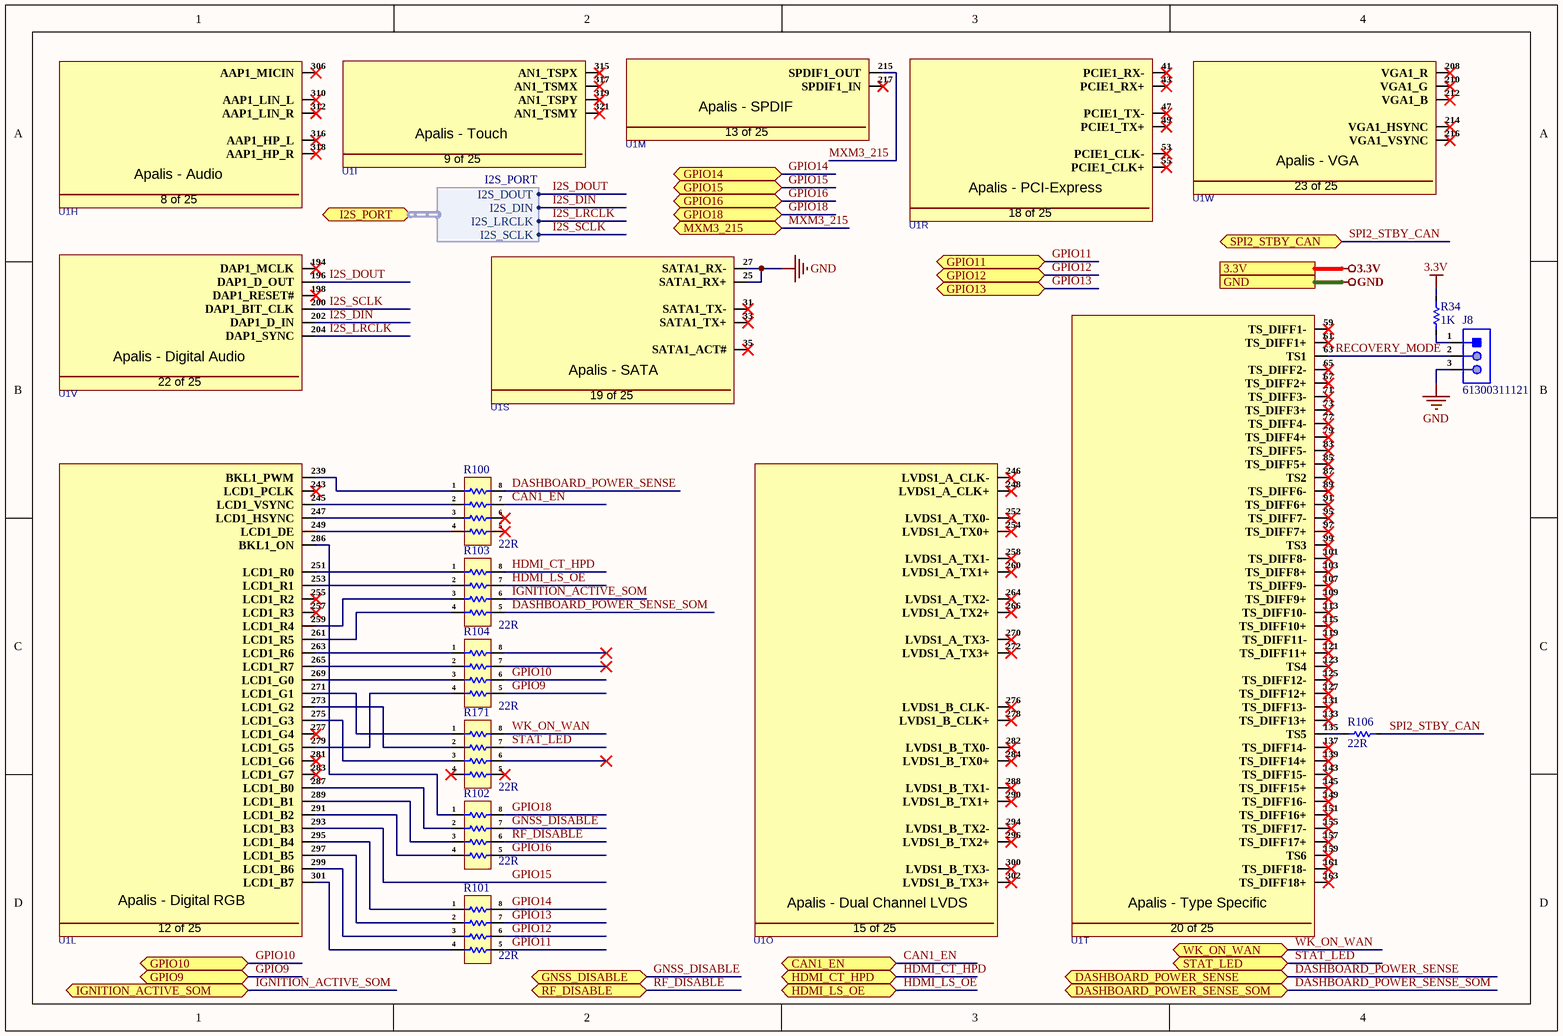
[diagram p12: GPIO_NC_INTERFACE.SchDoc]

### Parts
J8  61300311121  [HDR1X3_]
R34  1K  [Res-0603]
R100  22R  [YC164-JR-0722RL]
R101  22R  [YC164-JR-0722RL]
R102  22R  [YC164-JR-0722RL]
R103  22R  [YC164-JR-0722RL]
R104  22R  [YC164-JR-0722RL]
R106  22R  [Res-0402]
R171  22R  [YC164-JR-0722RL]
U1  MM70-314B1-2-R300  [MM70-314B1-2-R300]  (value not drawn)  (parts H,I,L,M,O,R,S,T,V,W of 25)

### Ports
3.3V (see Top_Sheet[3B], 03-CAN2_SPI_CAN_CONTROLLER[1D], APALIS_POWER_SUPPLY[1D], CAN2_SPI_CAN_CONTROLLER[1D], DC_DC_CONVERTER[1D], I2C_INTERFACE[1B], LTE_MODULE[1D], Reset_and_SDIO[1D]), CAN1_EN (bidir, see Top_Sheet[2B], 03-CAN2_SPI_CAN_CONTROLLER[1D]), DASHBOARD_POWER_SENSE (bidir, see Top_Sheet[3B], CONNECTORS[3D], DIGITAL_I-O_O-P[1D]), DASHBOARD_POWER_SENSE_SOM (bidir, see Top_Sheet[3B], DIGITAL_I-O_O-P[1D]), GND (see Top_Sheet[2B], 03-CAN2_SPI_CAN_CONTROLLER[1D], APALIS_POWER_SUPPLY[1D], CAN2_SPI_CAN_CONTROLLER[1D], CODEC_INTERFACE[1D], CONNECTORS[1D], DC_DC_CONVERTER[1D], DIGITAL_I-O_O-P[1D], ETHERNET_INTERFACE[1D], FUTURE_USE_CONNECTOR[1D], HDMI_INTERFACE[1D], I2C_INTERFACE[1B], INPUT_SUPPLY_PROTECTION[1D], LTE_MODULE[1D], MECHANICAL_FOR_PCB[1D], MICRO_SD_CARD_INTERFACE[1D], Reset_and_SDIO[1D], UART_INTERFACE[1D], USB3.0_INTERFACE[1D]), GNSS_DISABLE (bidir, see Top_Sheet[3C], LTE_MODULE[3D]), GPIO9 (bidir, see Top_Sheet[2C], CONNECTORS[2D], FUTURE_USE_CONNECTOR[3C]), GPIO10 (bidir, see Top_Sheet[2C], FUTURE_USE_CONNECTOR[3C]), GPIO11 (bidir, see Top_Sheet[2C], CONNECTORS[2D], FUTURE_USE_CONNECTOR[3C]), GPIO12 (bidir, see Top_Sheet[2C], CONNECTORS[2D], FUTURE_USE_CONNECTOR[3C]), GPIO13 (bidir, see Top_Sheet[2C], CONNECTORS[2D], FUTURE_USE_CONNECTOR[3C]), GPIO14 (bidir, see Top_Sheet[2C], FUTURE_USE_CONNECTOR[3C]), GPIO15 (bidir, see Top_Sheet[3C], FUTURE_USE_CONNECTOR[3C]), GPIO16 (bidir, see Top_Sheet[3C], FUTURE_USE_CONNECTOR[3D]), GPIO18 (bidir, see Top_Sheet[3B], DIGITAL_I-O_O-P[1D]), HDMI_CT_HPD (bidir, see Top_Sheet[2B], HDMI_INTERFACE[1D]), HDMI_LS_OE (bidir, see Top_Sheet[2C], HDMI_INTERFACE[1D]), I2S_PORT (bidir, harness I2S_PORT, see Top_Sheet[3C], CODEC_INTERFACE[2D]), IGNITION_ACTIVE_SOM (bidir, see Top_Sheet[2C], DIGITAL_I-O_O-P[1D]), MXM3_215 (bidir, see Top_Sheet[3B], CODEC_INTERFACE[4D]), RF_DISABLE (bidir, see Top_Sheet[3C], LTE_MODULE[3D]), SPI2_STBY_CAN (bidir, see Top_Sheet[2C], CAN2_SPI_CAN_CONTROLLER[1D]), STAT_LED (bidir, see Top_Sheet[3C], LTE_MODULE[3D]), WK_ON_WAN (bidir, see Top_Sheet[3C], LTE_MODULE[3D])

### Harnesses
I2S_PORT: I2S_DOUT, I2S_DIN, I2S_LRCLK, I2S_SCLK

### Nets
3.3V: R34.2 ; port 3.3V
GND: J8.3 U1.25(SATA1_RX+) U1.27(SATA1_RX-) ; port GND
CAN1_EN: R100.7 ; port CAN1_EN
DASHBOARD_POWER_SENSE: R100.8 ; port DASHBOARD_POWER_SENSE
DASHBOARD_POWER_SENSE_SOM: R103.5 ; port DASHBOARD_POWER_SENSE_SOM
GNSS_DISABLE: R102.7 ; port GNSS_DISABLE
GPIO9: R104.5 ; port GPIO9
GPIO10: R104.6 ; port GPIO10
GPIO11: R101.5 ; port GPIO11
GPIO12: R101.6 ; port GPIO12
GPIO13: R101.7 ; port GPIO13
GPIO14: R101.8 ; port GPIO14
GPIO15: U1.293(LCD1_B3) ; port GPIO15
GPIO16: R102.5 ; port GPIO16
GPIO18: R102.8 ; port GPIO18
HDMI_CT_HPD: R103.8 ; port HDMI_CT_HPD
HDMI_LS_OE: R103.7 ; port HDMI_LS_OE
I2S_DIN: U1.202(DAP1_D_IN) ; port I2S_PORT.I2S_DIN
I2S_DOUT: U1.196(DAP1_D_OUT) ; port I2S_PORT.I2S_DOUT
I2S_LRCLK: U1.204(DAP1_SYNC) ; port I2S_PORT.I2S_LRCLK
I2S_SCLK: U1.200(DAP1_BIT_CLK) ; port I2S_PORT.I2S_SCLK
IGNITION_ACTIVE_SOM: R103.6 ; port IGNITION_ACTIVE_SOM
MXM3_215: U1.215(SPDIF1_OUT) ; port MXM3_215
RECOVERY_MODE: J8.2 U1.63(TS1)
RF_DISABLE: R102.6 ; port RF_DISABLE
SPI2_STBY_CAN: R106.2 ; port SPI2_STBY_CAN
STAT_LED: R171.7 ; port STAT_LED
WK_ON_WAN: R171.8 ; port WK_ON_WAN
NetJ8_1: J8.1 R34.1
NetR100_1: R100.1 U1.239(BKL1_PWM)
NetR100_2: R100.2 U1.245(LCD1_VSYNC)
NetR100_3: R100.3 U1.247(LCD1_HSYNC)
NetR100_4: R100.4 U1.249(LCD1_DE)
NetR101_1: R101.1 U1.295(LCD1_B4)
NetR101_2: R101.2 U1.297(LCD1_B5)
NetR101_3: R101.3 U1.299(LCD1_B6)
NetR101_4: R101.4 U1.301(LCD1_B7)
NetR102_1: R102.1 U1.286(BKL1_ON)
NetR102_2: R102.2 U1.287(LCD1_B0)
NetR102_3: R102.3 U1.289(LCD1_B1)
NetR102_4: R102.4 U1.291(LCD1_B2)
NetR103_1: R103.1 U1.251(LCD1_R0)
NetR103_2: R103.2 U1.253(LCD1_R1)
NetR103_3: R103.3 U1.259(LCD1_R4)
NetR103_4: R103.4 U1.261(LCD1_R5)
NetR104_1: R104.1 U1.263(LCD1_R6)
NetR104_2: R104.2 U1.265(LCD1_R7)
NetR104_3: R104.3 U1.269(LCD1_G0)
NetR104_4: R104.4 U1.279(LCD1_G5)
NetR106_1: R106.1 U1.135(TS5)
NetR171_1: R171.1 U1.271(LCD1_G1)
NetR171_2: R171.2 U1.273(LCD1_G2)
NetR171_3: R171.3 U1.275(LCD1_G3)

Not connected (* = marked no-connect by the designer): R100 5* 6*; R104 7* 8*; R171 4* 5* 6*; U1 31(SATA1_TX-)* 33(SATA1_TX+)* 35(SATA1_ACT#)* 41(PCIE1_RX-)* 43(PCIE1_RX+)* 47(PCIE1_TX-)* 49(PCIE1_TX+)* 53(PCIE1_CLK-)* 55(PCIE1_CLK+)* 59(TS_DIFF1-)* 61(TS_DIFF1+)* 65(TS_DIFF2-)* 67(TS_DIFF2+)* 71(TS_DIFF3-)* 73(TS_DIFF3+)* 77(TS_DIFF4-)* 79(TS_DIFF4+)* 83(TS_DIFF5-)* 85(TS_DIFF5+)* 87(TS2)* 89(TS_DIFF6-)* 91(TS_DIFF6+)* 95(TS_DIFF7-)* 97(TS_DIFF7+)* 99(TS3)* 101(TS_DIFF8-)* 103(TS_DIFF8+)* 107(TS_DIFF9-)* 109(TS_DIFF9+)* 113(TS_DIFF10-)* 115(TS_DIFF10+)* 119(TS_DIFF11-)* 121(TS_DIFF11+)* 123(TS4)* 125(TS_DIFF12-)* 127(TS_DIFF12+)* 131(TS_DIFF13-)* 133(TS_DIFF13+)* 137(TS_DIFF14-)* 139(TS_DIFF14+)* 143(TS_DIFF15-)* 145(TS_DIFF15+)* 149(TS_DIFF16-)* 151(TS_DIFF16+)* 155(TS_DIFF17-)* 157(TS_DIFF17+)* 159(TS6)* 161(TS_DIFF18-)* 163(TS_DIFF18+)* 194(DAP1_MCLK)* 198(DAP1_RESET#)* 208(VGA1_R)* 210(VGA1_G)* 212(VGA1_B)* 214(VGA1_HSYNC)* 216(VGA1_VSYNC)* 217(SPDIF1_IN)* 243(LCD1_PCLK)* 246(LVDS1_A_CLK-)* 248(LVDS1_A_CLK+)* 252(LVDS1_A_TX0-)* 254(LVDS1_A_TX0+)* 255(LCD1_R2)* 257(LCD1_R3)* 258(LVDS1_A_TX1-)* 260(LVDS1_A_TX1+)* 264(LVDS1_A_TX2-)* 266(LVDS1_A_TX2+)* 270(LVDS1_A_TX3-)* 272(LVDS1_A_TX3+)* 276(LVDS1_B_CLK-)* 277(LCD1_G4)* 278(LVDS1_B_CLK+)* 281(LCD1_G6)* 282(LVDS1_B_TX0-)* 283(LCD1_G7)* 284(LVDS1_B_TX0+)* 288(LVDS1_B_TX1-)* 290(LVDS1_B_TX1+)* 294(LVDS1_B_TX2-)* 296(LVDS1_B_TX2+)* 300(LVDS1_B_TX3-)* 302(LVDS1_B_TX3+)* 306(AAP1_MICIN)* 310(AAP1_LIN_L)* 312(AAP1_LIN_R)* 315(AN1_TSPX)* 316(AAP1_HP_L)* 317(AN1_TSMX)* 318(AAP1_HP_R)* 319(AN1_TSPY)* 321(AN1_TSMY)*

### Notes on the sheet
- (in symbol MM70-314B1-2-R300, part H) Apalis - Audio; 8 of 25
- (in symbol MM70-314B1-2-R300, part I) Apalis - Touch; 9 of 25
- (in symbol MM70-314B1-2-R300, part L) Apalis - Digital RGB; 12 of 25
- (in symbol MM70-314B1-2-R300, part M) Apalis - SPDIF; 13 of 25
- (in symbol MM70-314B1-2-R300, part O) Apalis - Dual Channel LVDS; 15 of 25
- (in symbol MM70-314B1-2-R300, part R) Apalis - PCI-Express; 18 of 25
- (in symbol MM70-314B1-2-R300, part S) Apalis - SATA; 19 of 25
- (in symbol MM70-314B1-2-R300, part T) Apalis - Type Specific; 20 of 25
- (in symbol MM70-314B1-2-R300, part V) Apalis - Digital Audio; 22 of 25
- (in symbol MM70-314B1-2-R300, part W) Apalis - VGA; 23 of 25

### Library data of the parts
J8 = 61300311121: CONN HEADER VERT 3POS 2.54MM; Manufacturer: Wurth Electronics; Number of Positions: 3; Gender: Male; Connector Type: Male Pin; Pitch: 0.1inch; Item Type: Male Header; Supplier 1: Digi-Key; Manufacturer Part Number: 61300311121; Stock 1: 81286; Pricing 1: 1=0.13, 10=0.106, 25=0.088, 50=0.074, 100=0.067, 1000=0.061 (USD); Mount: Through Hole; Contact Plating: Gold; Contact Material: Copper; Color: Black; Number of Rows: 1; Packaging: Bulk; Termination: Solder; Number of Contacts: 3; Contact Mating Length: 0.236inch; REACH SVHC: Unknown; Lead Free: Lead Free; ComponentLink1URL: http://www.farnell.com/cad/1737268.pdf?src-supplier=Element14; ComponentLink1Description: http://www.farnell.com/cad/1737268.pdf?src-supplier=Element14; ComponentLink2URL: https://katalog.we-online.de/em/datasheet/6130xx11121.pdf?src-supplier=Digi-Key; ComponentLink2Description: https://katalog.we-online.de/em/datasheet/6130xx11121.pdf?src-supplier=Digi-Key; Supplier Part Number 1: 732-5316-ND
R34 = RT0603BRD071KL: RES SMD 1K OHM 0.1% 1/10W 0603; Manufacturer: Yageo; Resistance: 1kR; Power Rating: 100mW; Voltage Rating: 75V; Temperature Coefficient: 25ppm/°C; Voltage Rating (DC): 50V; Item Type: Resistor; Supplier 1: Arrow Electronics; Manufacturer Part Number: RT0603BRD071KL; RoHS: Yes; Category: Chip SMD Resistors; Stock 1: 130000; Pricing 1: 5000=0.03900, 10000=0.03450, 25000=0.03070, 50000=0.02040 (USD); Mount: Surface Mount; Case/Package: 0603; Case Code (Metric): 1608; Case Code (Imperial): 0603; Contact Plating: Tin,Lead; Size Code: 0603; Min Operating Temperature: -55°C; Max Operating Temperature: 125°C; Package Quantity: 5000; Packaging: Tape and Reel; Resistor Type: Thin Film; Number of Terminations: 2; Termination: SMD/SMT; Max Power Dissipation: 100mW; Features: Moisture Resistant; Series: RT; Technology: THIN FILM; Construction: Rectangular; Length: 1.6mm; Width: 0.031inch; Height: 0.022inch; Depth: 0.8mm; Military Standard: Not; Lead Free: Lead Free; RoHS Compliant: Yes; ComponentLink1URL: https://datasheet.ciiva.com/11819/0900766b8079c86e-11819652.pdf?src-supplier=RSComponents; ComponentLink1Description: https://datasheet.ciiva.com/11819/0900766b8079c86e-11819652.pdf?src-supplier=RSComponents; ComponentLink2URL: https://datasheet.ciiva.com/5624/pyu-rt-1-to-0-05-rohs-l-4-5624759.pdf?src-supplier=Mouser; ComponentLink2Description: https://datasheet.ciiva.com/5624/pyu-rt-1-to-0-05-rohs-l-4-5624759.pdf?src-supplier=Mouser; ComponentLink3URL: https://datasheet.ciiva.com/29718/pyu-rt-1-to-0-05-rohs-l-4-29718010.pdf?src-supplier=Digi-Key; ComponentLink3Description: https://datasheet.ciiva.com/29718/pyu-rt-1-to-0-05-rohs-l-4-29718010.pdf?src-supplier=Digi-Key; ComponentLink4URL: https://datasheet.ciiva.com/29718/pyu-rt-1-to-0-05-rohs-l-4-29718011.pdf?src-supplier=Digi-Key; ComponentLink4Description: https://datasheet.ciiva.com/29718/pyu-rt-1-to-0-05-rohs-l-4-29718011.pdf?src-supplier=Digi-Key; Supplier Part Number 1: RT0603BRD071KL; LCSC Part Number: C110776
R100-R104 R171 = YC164-JR-0722RL: as R84 on sheet FUTURE_USE_CONNECTOR; Supplier: Future Electronics; Supplier Part Number: 4472155; Manufacturer Part Number: YC164-JR-0722RL; RoHS: Yes; Category: Resistor Arrays; Stock: 225000; Pricing: 5000=0.0084, 20000=0.008, 50000=0.0078, 125000=0.0075, 200000=0.0071 (USD); ComponentLink1URL: https://datasheet.ciiva.com/8018/443424-8018007.pdf?src-supplier=Element14; ComponentLink1Description: https://datasheet.ciiva.com/8018/443424-8018007.pdf?src-supplier=Element14; ComponentLink2URL: https://datasheet.ciiva.com/8018/443424-8018008.pdf?src-supplier=Element14; ComponentLink2Description: https://datasheet.ciiva.com/8018/443424-8018008.pdf?src-supplier=Element14; ComponentLink3URL: https://datasheet.ciiva.com/2688/pyu-yc-tc164-51-rohs-l-3-2688422.pdf?src-supplier=Digi-Key; ComponentLink3Description: https://datasheet.ciiva.com/2688/pyu-yc-tc164-51-rohs-l-3-2688422.pdf?src-supplier=Digi-Key; ComponentLink4URL: https://datasheet.ciiva.com/2688/pyu-yc-tc164-51-rohs-l-3-2688421.pdf?src-supplier=Digi-Key; ComponentLink4Description: https://datasheet.ciiva.com/2688/pyu-yc-tc164-51-rohs-l-3-2688421.pdf?src-supplier=Digi-Key; ComponentLink5URL: https://datasheet.ciiva.com/8320/pyu-yc-tc164-51-rohs-l-3-8320230.pdf?src-supplier=Avnet; ComponentLink5Description: https://datasheet.ciiva.com/8320/pyu-yc-tc164-51-rohs-l-3-8320230.pdf?src-supplier=Avnet; ComponentLink6URL: https://datasheet.ciiva.com/2688/pyu-yc-tc164-51-rohs-l-3-2688423.pdf?src-supplier=Digi-Key; ComponentLink6Description: https://datasheet.ciiva.com/2688/pyu-yc-tc164-51-rohs-l-3-2688423.pdf?src-supplier=Digi-Key; ComponentLink7URL: https://datasheet.ciiva.com/17030/pyu-yc-tc164-51-rohs-l-3-17030158.pdf?src-supplier=Future+Electronics; ComponentLink7Description: https://datasheet.ciiva.com/17030/pyu-yc-tc164-51-rohs-l-3-17030158.pdf?src-supplier=Future+Electronics; ComponentLink8URL: https://datasheet.ciiva.com/28379/pyu-yc-tc164-51-rohs-l-3-28379358.pdf?; ComponentLink8Description: https://datasheet.ciiva.com/28379/pyu-yc-tc164-51-rohs-l-3-28379358.pdf?
R106 = CRGCQ0402J22R: as R120-R123 on sheet I2C_INTERFACE; Supplier: Avnet; Supplier Part Number: 73AC8982; Manufacturer Part Number: CRGCQ0402J22R; RoHS: Yes; Category: Chip SMD Resistors; Stock: 20000; Pricing: 1=0.036, 25=0.01, 100=0.008, 250=0.006, 500=0.005 (USD); ComponentLink1URL: https://www.te.com/commerce/DocumentDelivery/DDEController?Action=srchrtrv&amp;DocNm=1773204-3&amp;DocType=DS&amp;DocLang=English&src-supplier=Digi-Key; ComponentLink1Description: https://www.te.com/commerce/DocumentDelivery/DDEController?Action=srchrtrv&amp;DocNm=1773204-3&amp;DocType=DS&amp;DocLang=English&src-supplier=Digi-Key; ComponentLink2URL: https://4donline.ihs.com/images/VipMasterIC/IC/TYEL/TYEL-S-A0004929575/TYEL-S-A0004929575-1.pdf?hkey=52A5661711E402568146F3353EA87419&src-supplier=Newark; ComponentLink2Description: https://4donline.ihs.com/images/VipMasterIC/IC/TYEL/TYEL-S-A0004929575/TYEL-S-A0004929575-1.pdf?hkey=52A5661711E402568146F3353EA87419&src-supplier=Newark; ComponentLink3URL: https://4donline.ihs.com/images/VipMasterIC/IC/TYEL/TYEL-S-A0004929575/TYEL-S-A0004929575-1.pdf?hkey=52A5661711E402568146F3353EA87419&src-supplier=Element14; ComponentLink3Description: https://4donline.ihs.com/images/VipMasterIC/IC/TYEL/TYEL-S-A0004929575/TYEL-S-A0004929575-1.pdf?hkey=52A5661711E402568146F3353EA87419&src-supplier=Element14; ComponentLink4URL: https://datasheet.octopart.com/CRGCQ0402J22R-TE-Connectivity-datasheet-114679081.pdf?src-supplier=Master+Electronics; ComponentLink4Description: https://datasheet.octopart.com/CRGCQ0402J22R-TE-Connectivity-datasheet-114679081.pdf?src-supplier=Master+Electronics
U1 = MM70-314B1-2-R300: as U1 on sheet FUTURE_USE_CONNECTOR; Supplier: Digi-Key; Supplier Part Number: 670-MM70-314B1-2-R300CT-ND; Manufacturer Part Number: MM70-314B1-2-R300; RoHS: No; Category: Card Edge Connectors; Stock: 4979; Pricing: 1=9.21, 10=8.287, 25=7.8064, 50=7.6064, 100=7.4062 (USD)